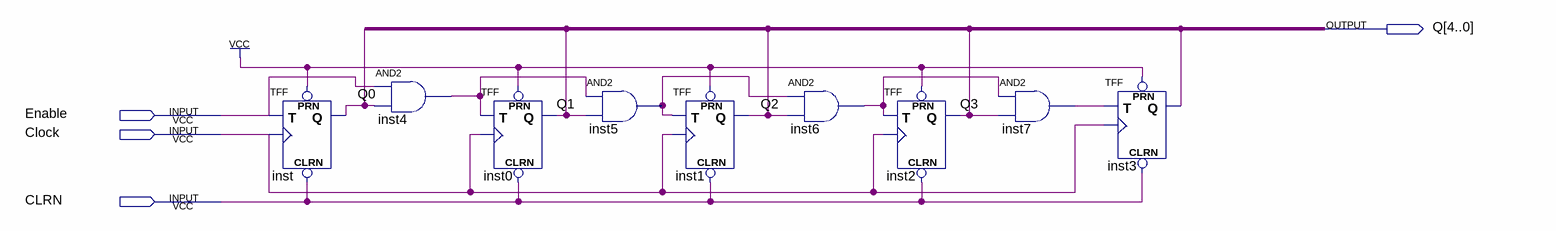
[diagram p0: schematic sheet]
// Quartus schematic lab10step2b.bdf as structural Verilog: 9 symbols, 4 pins
module lab10step2b (
  input  Enable,
  input  Clock,
  input  CLRN,
  output [4:0] Q
);

  wire inst3_q, inst4_out, inst5_out, inst6_out, inst7_out;

  TFF inst (.PRN(1'b1), .CLRN(CLRN), .T(Enable), .CLK(Clock), .Q(Q[0]));
  and inst4 (inst4_out, Enable, Q[0]);
  TFF inst0 (.PRN(1'b1), .CLRN(CLRN), .T(inst4_out), .CLK(Clock), .Q(Q[1]));
  and inst5 (inst5_out, inst4_out, Q[1]);
  TFF inst1 (.PRN(1'b1), .CLRN(CLRN), .T(inst5_out), .CLK(Clock), .Q(Q[2]));
  and inst6 (inst6_out, inst5_out, Q[2]);
  TFF inst2 (.PRN(1'b1), .CLRN(CLRN), .T(inst6_out), .CLK(Clock), .Q(Q[3]));
  and inst7 (inst7_out, inst6_out, Q[3]);
  TFF inst3 (.PRN(1'b1), .CLRN(CLRN), .T(inst7_out), .CLK(Clock), .Q(inst3_q));
endmodule
